# Altium project MMT.PrjPcb (part 2 of 2)

## Sheet Bus isolators.SchDoc
size A4; SheetNumber: 7; SheetTotal: 7
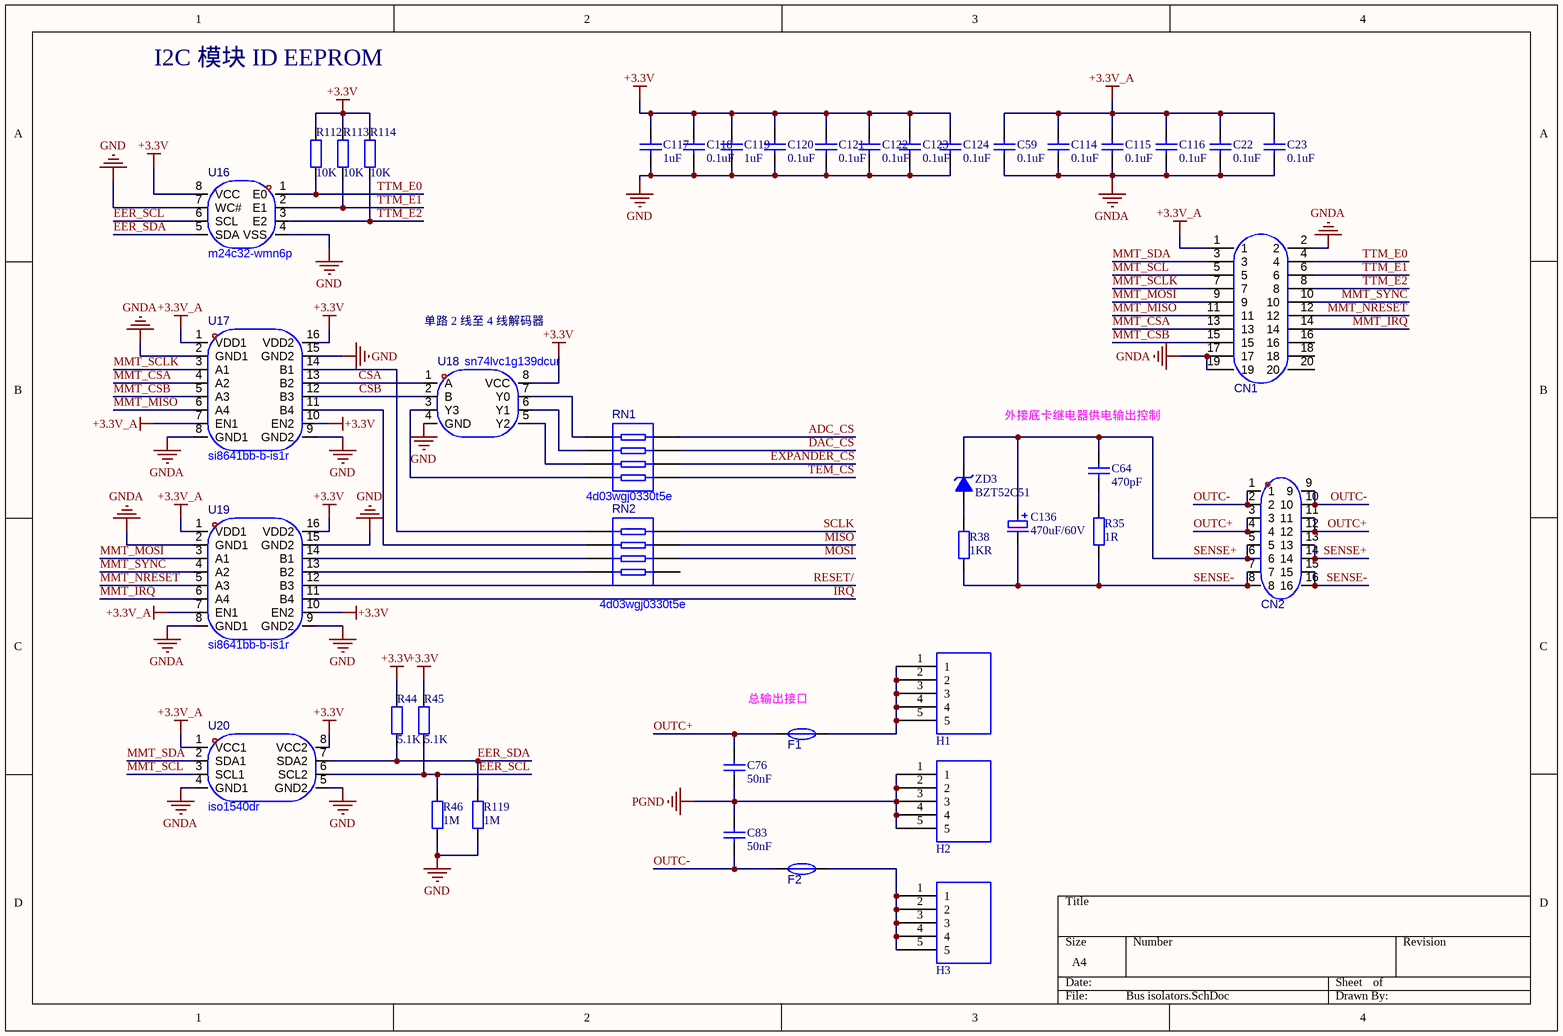
[diagram p6: Bus isolators.SchDoc]

### Parts
C22  0.1uF  [C0603]
C23  0.1uF  [C0603]
C59  0.1uF  [C0603]
C64  470pF  [C0805]
C76  50nF  [C0805]
C83  50nF  [C0805]
C114  0.1uF  [C0603]
C115  0.1uF  [C0603]
C116  0.1uF  [C0603]
C117  1uF  [C0603]
C118  0.1uF  [C0603]
C119  1uF  [C0603]
C120  0.1uF  [C0603]
C121  0.1uF  [C0603]
C122  0.1uF  [C0603]
C123  0.1uF  [C0603]
C124  0.1uF  [C0603]
C136  470uF/60V  [CAP-TH_BD8.0-P3.50-D0.5-FD]
CN1  sbh11-pbpc-d10-st-bk  [IDC-TH_20P-P2.54-V-R2-C10-S2.54]  (value not drawn)
CN2  c4201wr-2x8p  [CONN-TH_C4201WR-2X8P]  (value not drawn)
F1  xf-155  [FUSE-SMD_L10.5-W5.1]  (value not drawn)
F2  xf-155  [FUSE-SMD_L10.5-W5.1]  (value not drawn)
H1  4mm香蕉座  [4mmbanana]  (value not drawn)
H2  4mm香蕉座  [4mmbanana]  (value not drawn)
H3  4mm香蕉座  [4mmbanana]  (value not drawn)
R35  1R  [R0603]
R38  1KR  [R0603]
R44  5.1K  [R0603]
R45  5.1K  [R0603]
R46  1M  [R0603]
R112  10K  [R0603]
R113  10K  [R0603]
R114  10K  [R0603]
R119  1M  [R0603]
RN1  4d03wgj0330t5e  [RES-ARRAY-SMD_0603-8P-L3.2-W1.6-BL]
RN2  4d03wgj0330t5e  [RES-ARRAY-SMD_0603-8P-L3.2-W1.6-BL]
U16  m24c32-wmn6p  [SOIC-8_L4.9-W3.9-P1.27-LS6.0-BL]
U17  si8641bb-b-is1r  [SOIC-16_L9.9-W3.9-P1.27-LS6.0-BL]
U18  sn74lvc1g139dcur  [VSSOP-8_L2.3-W2.0-P0.50-LS3.1-BL]
U19  si8641bb-b-is1r  [SOIC-16_L9.9-W3.9-P1.27-LS6.0-BL]
U20  iso1540dr  [SOIC-8_L4.9-W3.9-P1.27-LS6.0-BL]
ZD3  BZT52C51  [SOD-123_L2.7-W1.6-LS3.7-RD]

### Nets
+3.3V: C117.2 C118.2 C119.2 C120.2 C121.2 C122.2 C123.2 C124.2 R44.2 R45.2 R112.2 R113.2 R114.2 U16.8(VCC) U17.10(EN2) U17.16(VDD2) U18.8(VCC) U19.10(EN2) U19.16(VDD2) U20.8(VCC2)
+3.3V_A: C22.2 C23.2 C59.2 C114.2 C115.2 C116.2 CN1.1 U17.1(VDD1) U17.7(EN1) U19.1(VDD1) U19.7(EN1) U20.1(VCC1)
GND: C76.1 C83.2 C117.1 C118.1 C119.1 C120.1 C121.1 C122.1 C123.1 C124.1 H2.1 H2.2 H2.3 H2.4 H2.5 R46.2 R119.2 U16.4(VSS) U16.7(WC#) U17.9(GND2) U17.15(GND2) U18.4(GND) U19.9(GND2) U19.15(GND2) U20.5(GND2)  [also labelled PGND]
GNDA: C22.1 C23.1 C59.1 C114.1 C115.1 C116.1 CN1.2 CN1.17 CN1.19 U17.2(GND1) U17.8(GND1) U19.2(GND1) U19.8(GND1) U20.4(GND1)
SENSE+: C64.2 C136.1 CN2.5 CN2.6 CN2.13 CN2.14 ZD3.1
SENSE-: C136.2 CN2.7 CN2.8 CN2.15 CN2.16 R35.1 R38.1
ADC_CS: RN1.8
CSA: U17.13(B2) U18.1(A)
CSB: U17.12(B3) U18.2(B)
DAC_CS: RN1.7
EER_SCL: R45.1 R46.1 U16.6(SCL) U20.6(SCL2)
EER_SDA: R44.1 R119.1 U16.5(SDA) U20.7(SDA2)
EXPANDER_CS: RN1.6
IRQ: U19.11(B4)
MISO: RN2.7
MMT_CSA: CN1.13 U17.4(A2)
MMT_CSB: CN1.15 U17.5(A3)
MMT_IRQ: CN1.14 U19.6(A4)
MMT_MISO: CN1.11 U17.6(A4)
MMT_MOSI: CN1.9 U19.3(A1)
MMT_NRESET: CN1.12 U19.5(A3)
MMT_SCL: CN1.5 U20.3(SCL1)
MMT_SCLK: CN1.7 U17.3(A1)
MMT_SDA: CN1.3 U20.2(SDA1)
MMT_SYNC: CN1.10 U19.4(A2)
MOSI: RN2.6
OUTC+: C76.2 CN2.3 CN2.4 CN2.11 CN2.12 F1.1
OUTC-: C83.1 CN2.1 CN2.2 CN2.9 CN2.10 F2.1
RESET/: U19.12(B3)
SCLK: RN2.8
TEM_CS: RN1.5
TTM_E0: CN1.4 R112.1 U16.1(E0)
TTM_E1: CN1.6 R113.1 U16.2(E1)
TTM_E2: CN1.8 R114.1 U16.3(E2)
NetC64_1: C64.1 R35.2
NetF1_2: F1.2 H1.1 H1.2 H1.3 H1.4 H1.5
NetF2_2: F2.2 H3.1 H3.2 H3.3 H3.4 H3.5
NetR38_2: R38.2 ZD3.2
NetRN1_1: RN1.1 U18.7(Y0)
NetRN1_2: RN1.2 U18.6(Y1)
NetRN1_3: RN1.3 U18.5(Y2)
NetRN1_4: RN1.4 U18.3(Y3)
NetRN2_1: RN2.1 U17.14(B1)
NetRN2_2: RN2.2 U17.11(B4)
NetRN2_3: RN2.3 U19.14(B1)
NetRN2_4: RN2.4 U19.13(B2)

Not connected (* = marked no-connect by the designer): CN1 16 18 20; RN2 5

### Notes on the sheet
- I2C 模块 ID EEPROM
- 单路 2 线至 4 线解码器
- 外接底卡继电器供电输出控制
- (near F1) 总输出接口

### Library data of the parts
C22 C23 C59 C114-C124 = C0603: Capacitor; Value: 104; Published: 8-Jun-2000; LatestRevisionDate: 17-Jul-2002; LatestRevisionNote: Re-released for DXP Platform.; Publisher: Altium Limited
C64 C76 C83 = C0805: Capacitor; Value: 104; Published: 8-Jun-2000; LatestRevisionDate: 17-Jul-2002; LatestRevisionNote: Re-released for DXP Platform.; Publisher: Altium Limited
C136 = CAP_EC_1: 贴片铝电解电容（RVT1V101M0607）; Part Number: *; Brand: *
CN1 = sbh11-pbpc-d10-st-bk: 插针结构:2x10P;间距:2.54mm;安装方式:直插;总PIN数:20P;排数:2;每排PIN数:10;行距:2.54mm;额定电流:3A;触头材质:黄铜;触头镀层:金;工作温度:-40℃~+105℃;; Manufacturer: Sullins; AddInBom: yes; ModelId: 919cb9b113224b379d0081fecd8b0ef1; ModelTransform: 1299.21,358.267,0,0,0,0,0,5.906,-118.11; Pins Structure: 2x10P; Pitch: 2.54mm; Number of PINs Per Row: 10; Current Rating: 3A; Flame Retardant Rating: UL94V-0; Symbol: SBH11-PBPC-D10-ST-BK; LCSC Part Name: 2x10P 间距:2.54mm 直插; SupplierPart: C17537739; ManufacturerPart: SBH11-PBPC-D10-ST-BK; Supplier Footprint: 插件; JLCPCB Part Class: Extended Part; Datasheet: https://item.szlcsc.com/datasheet/SBH11-PBPC-D10-ST-BK/18666954.html; Supplier: LCSC; ConvertToPcb: yes; FootprintName: IDC-TH_20P-P2.54-V-R2-C10-S2.54; ModelName: IDC-TH_20P-P2.54-V-R2-C10-S2.54; Mounting Type: 直插; Number of Pins: 20P; Number of Rows: 2; Row Spacing: 2.54mm; Contact Material: 黄铜; Contact Plating: 金; Operating Temperature: -40℃~+105℃; Color: 黑色
CN2 = c4201wr-2x8p: 插针结构:2x8P;间距:4.2mm;安装方式:弯插;参考系列:-;总PIN数:16P;排数:2;每排PIN数:8;行距:4.2mm;额定电流:13A;触头材质:黄铜;触头镀层:锡;工作温度:-40℃~+105℃;; Manufacturer: CJT(长江连接器); AddInBom: yes; ModelId: 521ba02425c74688a42912bee7d757d4; ModelTransform: 1385.824,772.046,0,0,0,0,-7.874,255.906,-137.795; Pins Structure: 2x8P; Pitch: 4.2mm; Number of PINs Per Row: 8; Current Rating: 13A; Voltage Rating: 600V; Plastic Material: PA66; Flame Retardant Rating: UL94V-2; Symbol: C4201WR-2X8P; LCSC Part Name: 2x8P 间距:4.2mm 弯插; SupplierPart: C239502; ManufacturerPart: C4201WR-2x8P; Supplier Footprint: 弯插,P=4.2mm; JLCPCB Part Class: Extended Part; Datasheet: https://item.szlcsc.com/datasheet/C4201WR-2x8P/238606.html; Supplier: LCSC; ConvertToPcb: yes; FootprintName: CONN-TH_C4201WR-2X8P; ModelName: CONN-TH_C4201WR-2X8P; Mounting Type: 弯插; Reference Series: -; Number of Pins: 16P; Number of Rows: 2; Row Spacing: 4.2mm; Contact Material: 黄铜; Contact Plating: 锡; Operating Temperature: -40℃~+105℃; Color: -
F1 F2 = xf-155: 保险丝座类型:支座型;通道数:1;保险丝类型:长方体;; Manufacturer: XFCN(兴飞); AddInBom: yes; Fuseholder Type: 支座型; Number of Circuits: 1; Voltage Rating: 500V; Current Rating: 15A; Fuse Type: 长方体; Fuse Length: 6.1mm; Fuse Width: 2.5mm; Symbol: XF-155; LCSC Part Name: 15A 500V 支座型; SupplierPart: C41371860; ManufacturerPart: XF-155; Supplier Footprint: SMD; JLCPCB Part Class: Extended Part; Datasheet: https://item.szlcsc.com/datasheet/XF-155/43135981.html; Supplier: LCSC; ConvertToPcb: yes; FootprintName: FUSE-SMD_L10.5-W5.1
R35 R38 R44-R46 R112-R114 R119 = R0603: Resistor; Published: 8-Jun-2000; LatestRevisionDate: 17-Jul-2002; LatestRevisionNote: Re-released for DXP Platform.; Publisher: Altium Limited
RN1 RN2 = 4d03wgj0330t5e: 电阻器数:4;阻值:33Ω;精度:±5%;单个元件功率:62.5mW;温度系数:±200ppm/℃;; Manufacturer: UNI-ROYAL(厚声); AddInBom: yes; ModelId: edf39f9a2dca4b9a94267f442dd4f95a; ModelName: R0603-8P_L3.2-W1.6-H0.6; ModelTransform: 125.984,62.992,0,0,0,0,0,0,0; Number of Resistors: 4; Value: 33Ω; Tolerance: ±5%; Power(Watts): 62.5mW; Symbol: 4D03WGJ0330T5E; LCSC Part Name: 33Ω ±5%; SupplierPart: C25508; ManufacturerPart: 4D03WGJ0330T5E; Supplier Footprint: 0603x4; JLCPCB Part Class: Extended Part; Datasheet: https://atta.szlcsc.com/upload/public/pdf/source/20191224/C474318_2527498AE30E813171187CCD28401A71.pdf; Supplier: LCSC; ConvertToPcb: yes; FootprintName: RES-ARRAY-SMD_0603-8P-L3.2-W1.6-BL; Temperature Coefficient: ±200ppm/℃; Number of Pins: 8
U16 = m24c32-wmn6p: 接口类型:I2C;存储容量:32Kbit;时钟频率(fc):1MHz;; Manufacturer: ST(意法半导体); AddInBom: yes; ModelId: e81d2f7d937b4a6ab1dca543ff5d56a4; ModelName: SOIC-8_L4.9-W3.9-H1.7-LS6.0-P1.27; ModelTransform: 192.913,236.22,0,0,0,0,0,0,0; Interface: I2C; Memory Size: 32Kbit; Clock Frequency: 1MHz; Write Cycle Time(Tw): 5ms; Data Retention - TDR (Year): 200年; Write Cycle Endurance: 400万次; Voltage - Supply: 2.5V~5.5V; Symbol: M24C32-WMN6P; LCSC Part Name: 32 Kbit串行I2C总线EEPROM; SupplierPart: C1353147; ManufacturerPart: M24C32-WMN6P; Supplier Footprint: SOIC-8; JLCPCB Part Class: Extended Part; Datasheet: https://item.szlcsc.com/datasheet/M24C32-WMN6P/1443432.html; Supplier: LCSC; ConvertToPcb: yes; FootprintName: SOIC-8_L4.9-W3.9-P1.27-LS6.0-BL; Features: 内置上电复位(POR)；硬件写保护功能；内置错误纠正码(ECC)功能; Operating Temperature: -40℃~+85℃
U17 U19 = si8641bb-b-is1r: Manufacturer: SKYWORKS/SILICON LABS(芯科); AddInBom: yes; ModelId: c21ec766ec2643efb3352f8441994f4e; ModelName: SOIC-16_L9.9-W3.9-H1.8-LS6.0-P1.27; ModelTransform: 389.763,236.454,0,0,0,0,0,0,0; Number of Forward Channels: 3; Number of Reverse Channels: 1; Data Rate(Max): 150Mbps; Default Output: 低电平; Isolation Voltage(Vrms): 2500; CMTI(kV/us): 50kV/us; Voltage - Supply(VCCA): 2.375V~5.5V; Symbol: SI8641BB-B-IS1R; LCSC Part Name: SI8641BB-B-IS1R; SupplierPart: C461889; ManufacturerPart: SI8641BB-B-IS1R; Supplier Footprint: SOIC-16; JLCPCB Part Class: Extended Part; Datasheet: https://item.szlcsc.com/datasheet/SI8641BB-B-IS1R/466372.html; Supplier: LCSC; ConvertToPcb: yes; FootprintName: SOIC-16_L9.9-W3.9-P1.27-LS6.0-BL; Propagation Delay(tpd): -; Features: -; Voltage - Supply(VCCB): 2.375V~5.5V; Operating Temperature: -40℃~+125℃
U18 = sn74lvc1g139dcur: 工作电压:1.65V~5.5V;输入数/输出数:-;灌电流(IOL):32mA;拉电流(IOH):32mA;; Manufacturer: TI(德州仪器); AddInBom: yes; ModelId: e6ad324e318e44b4bbc0fe09239e358c; ModelName: VSSOP-8_L2.3-W2.0-P0.50-LS3.1-BR; ModelTransform: 122.047,78.74,0,270,0,0,0,-0.002,0; Voltage Supply Source: 单电源; Current - Output Low(IOL): 32mA; Propagation Delay: 4.9ns@3.3V,15pF; Quiescent Current: 10uA; Symbol: SN74LVC1G139DCUR; LCSC Part Name: 2线-4线译码器; SupplierPart: C153798; ManufacturerPart: SN74LVC1G139DCUR; Supplier Footprint: VSSOP-8-0.5mm; JLCPCB Part Class: Extended Part; Datasheet: https://www.ti.com/cn/lit/gpn/sn74lvc1g139; Supplier: LCSC; ConvertToPcb: yes; FootprintName: VSSOP-8_L2.3-W2.0-P0.50-LS3.1-BL; Type: 解码器; Voltage - Supply: 1.65V~5.5V; Number of lines: -; Current - Output High(IOH): 32mA; Operating temperature: -40℃~+85℃; Function: -
U20 = iso1540dr: ISO1540 2.5kVrms、隔离式双向时钟、双向 I2C 隔离器; Manufacturer: TI(德州仪器); AddInBom: yes; ModelId: e81d2f7d937b4a6ab1dca543ff5d56a4; ModelName: SOIC-8_L4.9-W3.9-H1.7-LS6.0-P1.27; ModelTransform: 192.913,236.22,0,0,0,0,0,0,0; Clock Direction: 双向; Isolation Voltage(Vrms): 2500; CMTI(kV/us): 50kV/us; Symbol: ISO1540DR; LCSC Part Name: 低功耗双向I2C隔离器; SupplierPart: C179739; ManufacturerPart: ISO1540DR; Supplier Footprint: SOIC-8; JLCPCB Part Class: Extended Part; Datasheet: https://www.ti.com/cn/lit/gpn/iso1541; Supplier: LCSC; ConvertToPcb: yes; FootprintName: SOIC-8_L4.9-W3.9-P1.27-LS6.0-BL; Operating Temperature: -40℃~+125℃
ZD3 = DIO_ZENER_3: 20V稳压管; Brand: 10V; Part Number: *

## Nets that join several sheets
+3.3V: SMPS_POWER (Q8.2 Q12.2 R31.1 R47.1), Bias_Power_Supply (10 pins), CC_CV_Down-programmer (R10.2 R13.2), CC_CV_Indicators_and_sense_error (5 pins), DAC、ADC、IO_Espander (15 pins), Bus isolators (20 pins)
+5V: Bias_Power_Supply (9 pins), CC_CV_Down-programmer (6 pins)
+VREF: CC_CV_Down-programmer (R55.2), DAC、ADC、IO_Espander (11 pins)
AVDD: Bias_Power_Supply (5 pins), CC_CV_Down-programmer (9 pins), CC_CV_Indicators_and_sense_error (C89.2 C90.2 U10.8), DAC、ADC、IO_Espander (C96.2 C97.2 U14.12)
AVSS: Bias_Power_Supply (5 pins), CC_CV_Down-programmer (9 pins), CC_CV_Indicators_and_sense_error (C91.2 C92.2 U10.4), DAC、ADC、IO_Espander (C100.2 C101.2 U14.5)
GND: SMPS_POWER (42 pins), Bias_Power_Supply (33 pins), CC_CV_Down-programmer (35 pins), CC_CV_Indicators_and_sense_error (12 pins), DAC、ADC、IO_Espander (40 pins), Bus isolators (25 pins)
SENSE+: SMPS_POWER (14 pins), CC_CV_Down-programmer (6 pins), CC_CV_Indicators_and_sense_error (R94.1), Bus isolators (7 pins)
SENSE-: CC_CV_Down-programmer (5 pins), CC_CV_Indicators_and_sense_error (R100.1), Bus isolators (7 pins)
VIN: SMPS_POWER (17 pins), Bias_Power_Supply (C61.2 C63.2 R32.1 U5.7)
ADC_CS: DAC、ADC、IO_Espander (U14.2), Bus isolators (RN1.8)
CC_ACT: CC_CV_Indicators_and_sense_error (Q13.3 Q14.1 R27.2 R39.2), DAC、ADC、IO_Espander (U15.24)
CURR_10A: CC_CV_Down-programmer (R89.1), DAC、ADC、IO_Espander (U15.2)
CURR_500mA: CC_CV_Down-programmer (R74.1), DAC、ADC、IO_Espander (U15.1)
CV_ACT: CC_CV_Indicators_and_sense_error (Q7.3 Q9.1 R14.2 R37.2), DAC、ADC、IO_Espander (U15.23)
DAC_CS: DAC、ADC、IO_Espander (U13.5), Bus isolators (RN1.7)
DP_EN: CC_CV_Down-programmer (P28.1 R33.1), DAC、ADC、IO_Espander (U15.28)
EXPANDER_CS: DAC、ADC、IO_Espander (U15.11), Bus isolators (RN1.6)
FB: SMPS_POWER (C25.1 R12.1 R19.2 U1.11), CC_CV_Down-programmer (R73.1)
FB_Contral: CC_CV_Down-programmer (D11.2 D13.2 R73.2), CC_CV_Indicators_and_sense_error (R102.1)
I_MON: CC_CV_Down-programmer (R80.2 R86.2 U9.1), DAC、ADC、IO_Espander (R107.1)
I_SERVO: CC_CV_Down-programmer (C57.2 C58.2 D13.1 U8.1), CC_CV_Indicators_and_sense_error (R110.1)
I_SET_OUT: CC_CV_Down-programmer (R78.2), DAC、ADC、IO_Espander (R105.1 U13.3)
IRQ: DAC、ADC、IO_Espander (U15.20), Bus isolators (U19.11)
MISO: DAC、ADC、IO_Espander (U2.4 U14.15 U15.14), Bus isolators (RN2.7)
MODE_MPPT_EN: SMPS_POWER (Q8.1 R31.2), DAC、ADC、IO_Espander (U15.26)
MOSI: DAC、ADC、IO_Espander (U13.7 U14.16 U15.13), Bus isolators (RN2.6)
OUTC+: CC_CV_Indicators_and_sense_error (C86.2 P14.2 R90.2), Bus isolators (6 pins)
OUTC-: CC_CV_Indicators_and_sense_error (C88.1 N4.2 R103.2), Bus isolators (6 pins)
RESET/: DAC、ADC、IO_Espander (U15.18), Bus isolators (U19.12)
SCLK: DAC、ADC、IO_Espander (U2.3 U13.6 U14.1 U15.12), Bus isolators (RN2.8)
SENSE_ERR: CC_CV_Indicators_and_sense_error (N3.3 R98.1), DAC、ADC、IO_Espander (U15.21)
TEM_CS: DAC、ADC、IO_Espander (U2.1), Bus isolators (RN1.5)
U_MON: CC_CV_Down-programmer (R67.2 R71.1 U7.1), DAC、ADC、IO_Espander (R106.2)
U_SERVO: CC_CV_Down-programmer (6 pins), CC_CV_Indicators_and_sense_error (R88.1)
U_SET_OUT: CC_CV_Down-programmer (R81.2), DAC、ADC、IO_Espander (R108.2 U13.4)
UVLO: SMPS_POWER (Q12.1 R47.2), DAC、ADC、IO_Espander (U15.27)

## Assembly variants
NC: all parts fitted
NC_1: all parts fitted